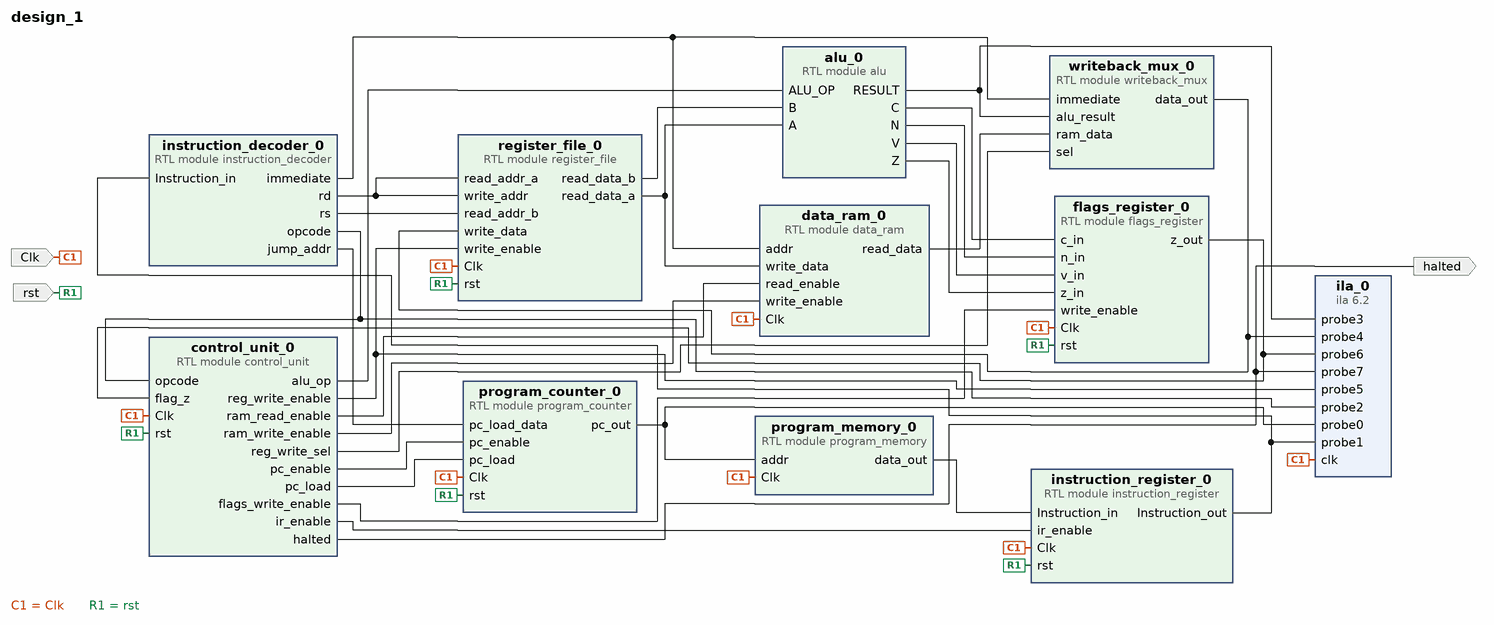
[diagram p0: block diagram of the top level]
# Vivado block design design_1, xc7a35tcpg236-1, Vivado 2025.1
create_bd_design design_1

create_bd_port -dir I -type clk Clk
create_bd_port -dir I -type rst rst
create_bd_port -dir O halted

create_bd_cell -type module -reference program_counter program_counter_0
create_bd_cell -type module -reference program_memory program_memory_0
create_bd_cell -type module -reference instruction_register instruction_register_0
create_bd_cell -type module -reference instruction_decoder instruction_decoder_0
create_bd_cell -type module -reference control_unit control_unit_0
create_bd_cell -type module -reference register_file register_file_0
create_bd_cell -type module -reference alu alu_0
create_bd_cell -type module -reference flags_register flags_register_0
create_bd_cell -type module -reference data_ram data_ram_0
create_bd_cell -type module -reference writeback_mux writeback_mux_0
create_bd_cell -type ip -vlnv xilinx.com:ip:ila:6.2 ila_0
set_property -dict [list \
  CONFIG.C_MONITOR_TYPE Native \
  CONFIG.C_NUM_OF_PROBES 8 \
  CONFIG.C_PROBE0_WIDTH 8 \
  CONFIG.C_PROBE1_WIDTH 16 \
  CONFIG.C_PROBE2_WIDTH 4 \
  CONFIG.C_PROBE3_WIDTH 8 \
  CONFIG.C_PROBE4_WIDTH 8 \
] [get_bd_cells ila_0]

# ---- connections ----

connect_bd_net -net Clk_0_1 [get_bd_ports Clk] \
  [get_bd_pins program_counter_0/Clk] [get_bd_pins instruction_register_0/Clk] [get_bd_pins control_unit_0/Clk] \
  [get_bd_pins register_file_0/Clk] [get_bd_pins flags_register_0/Clk] [get_bd_pins data_ram_0/Clk] [get_bd_pins ila_0/clk] \
  [get_bd_pins program_memory_0/Clk]
connect_bd_net [get_bd_pins alu_0/C] [get_bd_pins flags_register_0/c_in]
connect_bd_net [get_bd_pins alu_0/N] [get_bd_pins flags_register_0/n_in]
connect_bd_net [get_bd_pins alu_0/RESULT] [get_bd_pins writeback_mux_0/alu_result] [get_bd_pins ila_0/probe3]
connect_bd_net [get_bd_pins alu_0/V] [get_bd_pins flags_register_0/v_in]
connect_bd_net [get_bd_pins alu_0/Z] [get_bd_pins flags_register_0/z_in]
connect_bd_net [get_bd_pins control_unit_0/alu_op] [get_bd_pins alu_0/ALU_OP]
connect_bd_net [get_bd_pins control_unit_0/flags_write_enable] [get_bd_pins flags_register_0/write_enable]
connect_bd_net [get_bd_pins control_unit_0/halted] [get_bd_ports halted] [get_bd_pins ila_0/probe7]
connect_bd_net [get_bd_pins control_unit_0/ir_enable] [get_bd_pins instruction_register_0/ir_enable]
connect_bd_net [get_bd_pins control_unit_0/pc_enable] [get_bd_pins program_counter_0/pc_enable]
connect_bd_net [get_bd_pins control_unit_0/pc_load] [get_bd_pins program_counter_0/pc_load]
connect_bd_net [get_bd_pins control_unit_0/ram_read_enable] [get_bd_pins data_ram_0/read_enable]
connect_bd_net [get_bd_pins control_unit_0/ram_write_enable] [get_bd_pins data_ram_0/write_enable]
connect_bd_net [get_bd_pins control_unit_0/reg_write_enable] [get_bd_pins register_file_0/write_enable] [get_bd_pins ila_0/probe5]
connect_bd_net [get_bd_pins control_unit_0/reg_write_sel] [get_bd_pins writeback_mux_0/sel]
connect_bd_net [get_bd_pins data_ram_0/read_data] [get_bd_pins writeback_mux_0/ram_data]
connect_bd_net [get_bd_pins flags_register_0/z_out] [get_bd_pins control_unit_0/flag_z] [get_bd_pins ila_0/probe6]
connect_bd_net [get_bd_pins instruction_decoder_0/immediate] [get_bd_pins data_ram_0/addr] [get_bd_pins writeback_mux_0/immediate]
connect_bd_net [get_bd_pins instruction_decoder_0/jump_addr] [get_bd_pins program_counter_0/pc_load_data]
connect_bd_net [get_bd_pins instruction_decoder_0/opcode] [get_bd_pins control_unit_0/opcode] [get_bd_pins ila_0/probe2]
connect_bd_net [get_bd_pins instruction_decoder_0/rd] [get_bd_pins register_file_0/read_addr_a] [get_bd_pins register_file_0/write_addr]
connect_bd_net [get_bd_pins instruction_decoder_0/rs] [get_bd_pins register_file_0/read_addr_b]
connect_bd_net [get_bd_pins instruction_register_0/Instruction_out] [get_bd_pins instruction_decoder_0/Instruction_in] [get_bd_pins ila_0/probe1]
connect_bd_net [get_bd_pins program_counter_0/pc_out] [get_bd_pins ila_0/probe0] [get_bd_pins program_memory_0/addr]
connect_bd_net [get_bd_pins program_memory_0/data_out] [get_bd_pins instruction_register_0/Instruction_in]
connect_bd_net [get_bd_pins register_file_0/read_data_a] [get_bd_pins alu_0/A] [get_bd_pins data_ram_0/write_data]
connect_bd_net [get_bd_pins register_file_0/read_data_b] [get_bd_pins alu_0/B]
connect_bd_net -net rst_0_1 [get_bd_ports rst] \
  [get_bd_pins program_counter_0/rst] [get_bd_pins instruction_register_0/rst] [get_bd_pins register_file_0/rst] \
  [get_bd_pins control_unit_0/rst] [get_bd_pins flags_register_0/rst]
connect_bd_net [get_bd_pins writeback_mux_0/data_out] [get_bd_pins register_file_0/write_data] [get_bd_pins ila_0/probe4]

validate_bd_design
save_bd_design
